# EasyEDA Pro project IPT60R028G7半桥模块.epro

# Schematic Schematic4
Board Name: G7半桥; Create Date: 2025-01-18; Page Name: P1; Project Name: 开关电源实验平台(GaN); Schematic Name: Schematic4; Update Date: 2025-12-15; Company: 嘉立创EDA; Page Size: A4; Version: V1.0
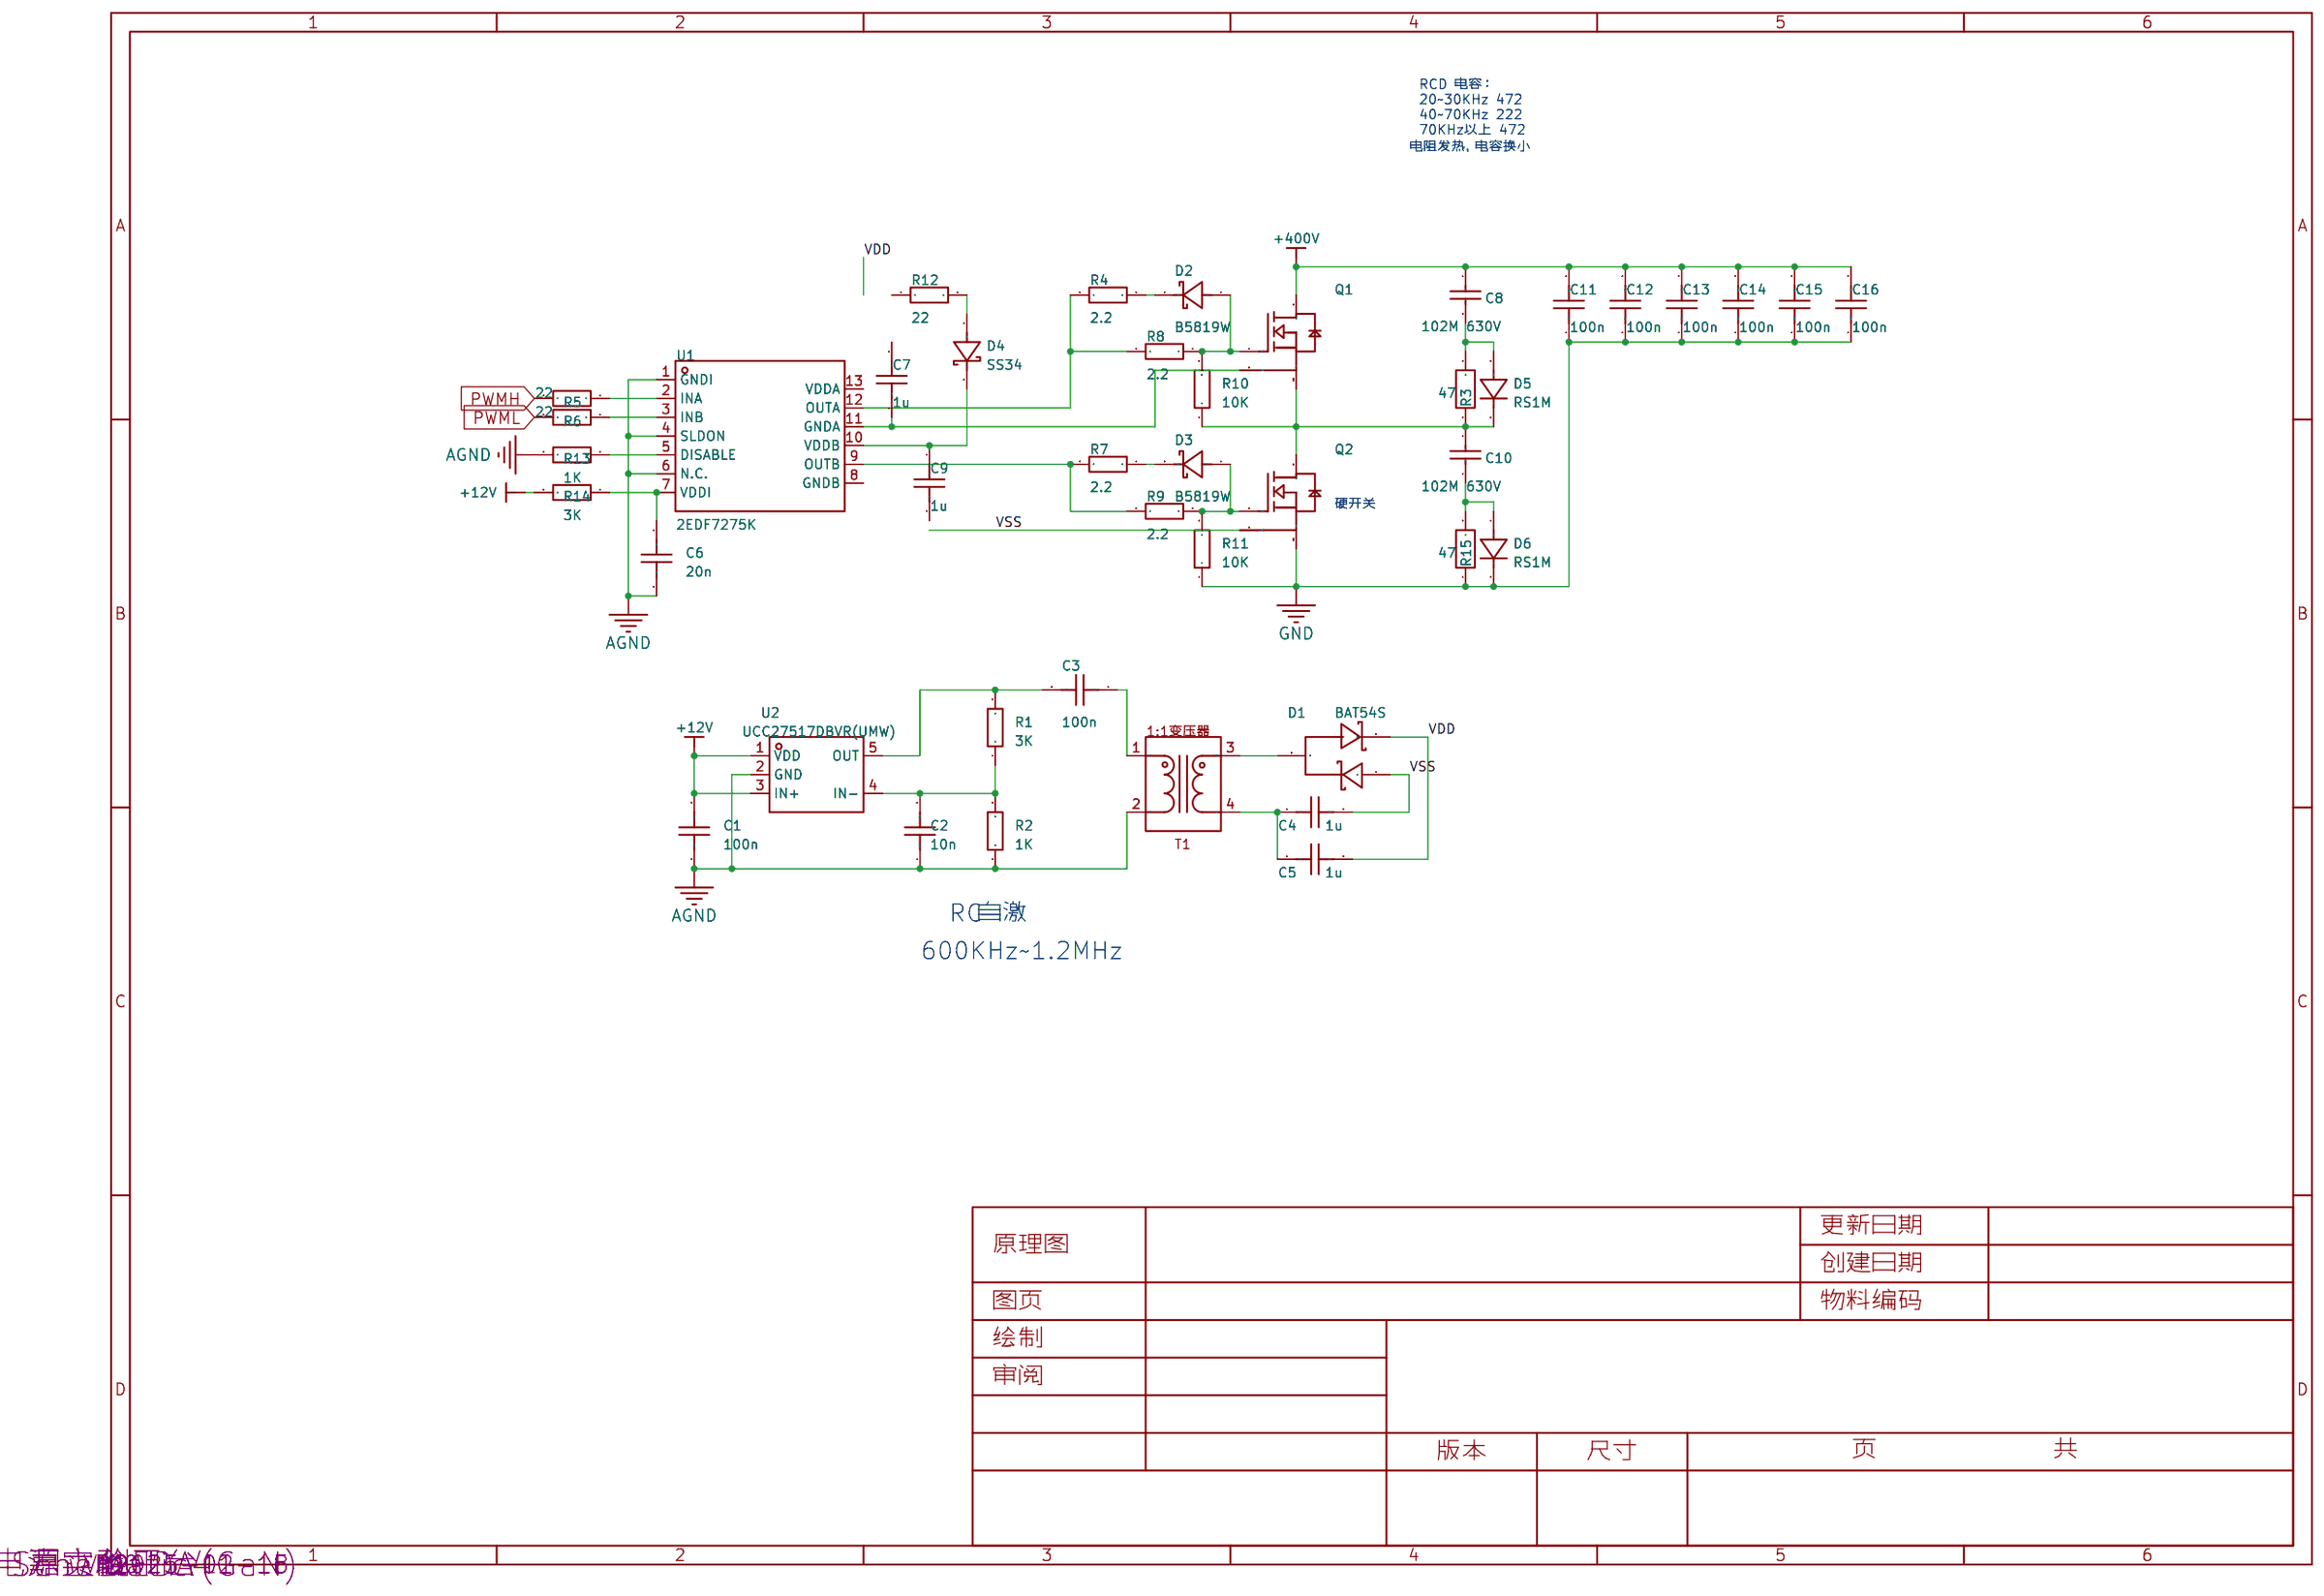
[diagram p0: schematic sheet]

## Parts
C1  100n  [C0603]
C2  10n  [C0603]
C3  100n  [C0603]
C4  1u  [C0805]
C5  1u  [C0805]
C6  20n  [C0603]
C7  1u  [C0603]
C8  102M 630V  [CAP-SMD_L8.0-W6.0-LS11.4]
C9  1u  [C0603]
C10  102M 630V  [CAP-SMD_L8.0-W6.0-LS11.4]
C11  100n  [C1812]
C12  100n  [C1812]
C13  100n  [C1812]
C14  100n  [C1812]
C15  100n  [C1812]
C16  100n  [C1812]
D1  BAT54S  [SOT-23-3_L3.0-W1.7-P0.95-LS2.9-BR]
D2  B5819W  [SOD-123_L2.7-W1.6-LS3.7-FD]
D3  B5819W  [SOD-123_L2.7-W1.6-LS3.7-FD]
D4  SS34  [SMA_L4.3-W2.6-LS5.0-FD]
D5  RS1M  [SMA_L4.3-W2.6-LS5.2-FD]
D6  RS1M  [SMA_L4.3-W2.6-LS5.2-FD]
Q1  -  [PG-HSOF-8-1_L10.4-W9.9-P1.2-LS11.7-TL_IPT60R035CFD7XTMA1]
Q2  -  [PG-HSOF-8-1_L10.4-W9.9-P1.2-LS11.7-TL_IPT60R035CFD7XTMA1]
R1  3K  [R0805]
R2  1K  [R0805]
R3  47  [R2512]
R4  2.2  [R0603]
R5  22  [R0603]
R6  22  [R0603]
R7  2.2  [R0603]
R8  2.2  [R0603]
R9  2.2  [R0603]
R10  10K  [R0805]
R11  10K  [R0805]
R12  22  [R0805]
R13  1K  [R0603]
R14  3K  [R0603]
R15  47  [R2512]
U1  2EDF7275K  [LGA-13_L5.0-W5.0-P0.65-TL]
U2  UCC27517DBVR(UMW)  [SOT-23-5_L3.0-W1.7-P0.95-LS2.8-BR]
U4  -  [迷你隔离变压器]

## Library data of the parts
C1-C3 C6 C7 C9 = CAP_0603: Supplier Footprint: 0603
C4 C5 = CAP_0805: Supplier Footprint: 0805
C8 C10 = 102M 630V: Supplier: LCSC; Supplier Part: C9900002784; Manufacturer Part: 安规Y电容472M 250 400V; Manufacturer: null; JLCPCB Part Class: Extended Part; Contributor: LCSC; spicePre: C; spiceSymbolName: 安规Y电容472M 250 400V
C11-C16 = 1812B104K631NT_C696256: 容值:100nF;精度:±10%;额定电压:630V;材质(温度系数):X7R;; LCSC Part Name: 100nF ±10% 630V; Supplier Part: C696256; Manufacturer: FH(风华); Manufacturer Part: 1812B104K631NT; Supplier Footprint: 1812; JLCPCB Part Class: 扩展库; Datasheet: https://atta.szlcsc.com/upload/public/pdf/source/20200305/C486355_26A10D38EF8C2A5C37091D0039909270.pdf; Supplier: LCSC; Tolerance: ±10%; Voltage Rated: 630V; Temperature Coefficient: X7R
D1 = BAT54S,215: 二极管配置:1对串联式;正向压降(Vf):800mV@100mA;直流反向耐压(Vr):30V;整流电流:200mA;; LCSC Part Name: 电压:30V 电流:200mA; Supplier Part: C47546; Manufacturer: Nexperia(安世); Supplier Footprint: SOT-23; JLCPCB Part Class: 扩展库; Datasheet: https://item.szlcsc.com/datasheet/BAT54S%252C215/48551.html; Supplier: LCSC; Diode Configuration: 1对串联式; Voltage - Forward(Vf@If): 800mV@100mA; Voltage - DC Reverse(Vr): 30V; Current - Rectified: 200mA; Reverse Leakage Current (Ir): 2uA@25V; Non-Repetitive Peak Forward Surge Current: 600mA
D2 D3 = B5819W_C7420330: 二极管配置:独立式;正向压降(Vf):550mV@1.0A;直流反向耐压(Vr):40V;整流电流:1A;; LCSC Part Name: 电压:40V 电流:1A; Supplier Part: C7420330; Manufacturer: 宏迦橙; Supplier Footprint: SOD-123; JLCPCB Part Class: 扩展库; Datasheet: https://atta.szlcsc.com/upload/public/pdf/source/20230828/EE0D571642CD3E42C48F1182066654A1.pdf; Supplier: LCSC; Diode Configuration: 独立式; Forward Voltage (Vf@If): 550mV@1.0A; Reverse Voltage (Vr): 40V; Rectified Current: 1A; Reverse Leakage Current (Ir): 1mA@30V
D4 = SS34_C7420365: 二极管配置:独立式;正向压降(Vf):550mV@3.0A;直流反向耐压(Vr):40V;平均整流电流(Io):3A;; LCSC Part Name: 电压:40V 电流:3A; Supplier Part: C7420365; Manufacturer: 宏迦橙; Supplier Footprint: SMA(DO-214AC); JLCPCB Part Class: 扩展库; Datasheet: https://atta.szlcsc.com/upload/public/pdf/source/20230828/75438452AEE6C276EDA92B2AF599BE05.pdf; Supplier: LCSC; Diode Configuration: 独立式; Forward Voltage (Vf@If): 550mV@3.0A; Reverse Voltage (Vr): 40V; Average Rectified Current (Io): 3A; Reverse Leakage Current (Ir): 200uA@40V; Peak forward surge current: 80A
D5 D6 = RS1M_C84573: 二极管配置:-;正向压降(Vf):1.3V@1A;直流反向耐压(Vr):1kV;整流电流:1A;反向恢复时间(Trr):500ns;; Supplier Part: C84573; Manufacturer: onsemi(安森美); Supplier Footprint: SMA(DO-214AC); JLCPCB Part Class: 扩展库; Datasheet: https://item.szlcsc.com/datasheet/RS1M/85743.html; Supplier: LCSC; Voltage - Forward(Vf@If): 1.3V@1A; Voltage - DC Reverse(Vr): 1kV; Current - Rectified: 1A; Reverse Leakage Current (Ir): 5uA@1kV; Reverse Recovery Time (trr): 500ns; Operating Junction Temperature Range: -55℃~+150℃; Pd - Power Dissipation: 1.19W; Non-Repetitive Peak Forward Surge Current: 30A
Q1 Q2 = IPT60R028G7: 650V245A28mΩ123nC
R1 R2 R10-R12 = Res_0805: Supplier Footprint: 0805
R3 R15 = 10k: nameAlias: Value(Ω); Contributor: LCEDA_Lib; spicePre: R; spiceSymbolName: R_AXIAL-0.5_EU
R4-R9 R13 R14 = Res_0603: Supplier Footprint: 0603
U1 = 2EDF7275K_C2677063: 驱动配置:半桥;负载类型:MOSFET;驱动通道数:2;峰值灌电流:8A;峰值拉电流:4A;电源电压:3V~3.5V;上升时间:6.5ns;下降时间:4.5ns;; Supplier Part: C2677063; Manufacturer: Infineon(英飞凌); Supplier Footprint: TFLGA-13; JLCPCB Part Class: 扩展库; Datasheet: https://atta.szlcsc.com/upload/public/pdf/source/20210606/C69F41D9A598FEEE25D6E8D6BBA83E77.pdf; Supplier: LCSC; Driven Configuration: 半桥; Load Type: MOSFET; Number of Drivers: 2; Peak Output Current(sink): 8A; Peak Output Current(source): 4A; Supply Voltage: 3V~3.5V; Rise Time: 6.5ns; Fall Time: 4.5ns; Operating Temperature: -40℃~+125℃@(Ta)
U2 = UCC27517DBVR(UMW): Supplier Part: C20623191; Manufacturer: UMW(友台半导体); Supplier Footprint: SOT-23-5; JLCPCB Part Class: 扩展库; Datasheet: https://atta.szlcsc.com/upload/public/pdf/source/20240221/377012E13C37207AC8C9D9341CE07B53.pdf; Supplier: LCSC
U4 = 隔离迷你变压器: 变比1：1

## Nets
+12V: C1.2 R14.2 U2.1(VDD) U2.3(IN+)
+400V: C8.1 C11.2 C12.2 C13.2 C14.2 C15.2 C16.2 Q1.9(D)
AGND: C1.1 C2.1 C6.2 R2.1 R13.2 U1.1(GNDI) U1.4(SLDON) U1.6(N.C.) U2.2(GND) U4.2(3)
GND: C11.1 C12.1 C13.1 C14.1 C15.1 C16.1 D6.2(K) Q2.3,4,5,6,7,8(S) R11.1 R15.1
VDD: C5.2 C7.1 D1.2(K) R12.1 U1.13(VDDA)
VSS: C4.2 C9.2 D1.1(A) Q2.2(S) U1.8(GNDB)
PWMH: R5.2
PWML: R6.2
$1N844: C2.2 R1.1 R2.2 U2.4(IN-)
$1N859: C3.2 R1.2 U2.5(OUT)
$1N994: C3.1 U4.1
$1N1111: D1.3(AK) U4.3(6)
$1N1173: C4.1 C5.1 U4.4
$1N1278: C6.1 R14.1 U1.7(VDDI)
$1N1386: R5.1 U1.2(INA)
$1N1390: R6.1 U1.3(INB)
$1N1992: D2.1(A) Q1.1(G) R8.1 R10.2
$1N2020: D3.1(A) Q2.1(G) R9.1 R11.2
$1N2779: C7.2 Q1.2(S) U1.11(GNDA)
$1N4845: C9.1 D4.2(K) U1.10(VDDB)
$1N5394: R13.1 U1.5(DISABLE)
$1N8959: D4.1(A) R12.2
$1N8960: C8.2 D5.1(A) R3.2
$1N8961: D2.2(K) R4.1
$1N8962: R4.2 R8.2 U1.12(OUTA)
$1N8963: D3.2(K) R7.1
$1N8964: R7.2 R9.2 U1.9(OUTB)
$1N8965: C10.2 D6.1(A) R15.2
Net-(C10-1): C10.1 D5.2(K) Q1.3,4,5,6,7,8(S) Q2.9(D) R3.1 R10.1

## Notes on the sheet
- RCD 电容：
  20~30KHz 472
  40~70KHz 222
  70KHz以上 472
- 电阻发热，电容换小
- 硬开关
- RC
- 自激
- 600KHz~1.2MHz

# Board PCB9
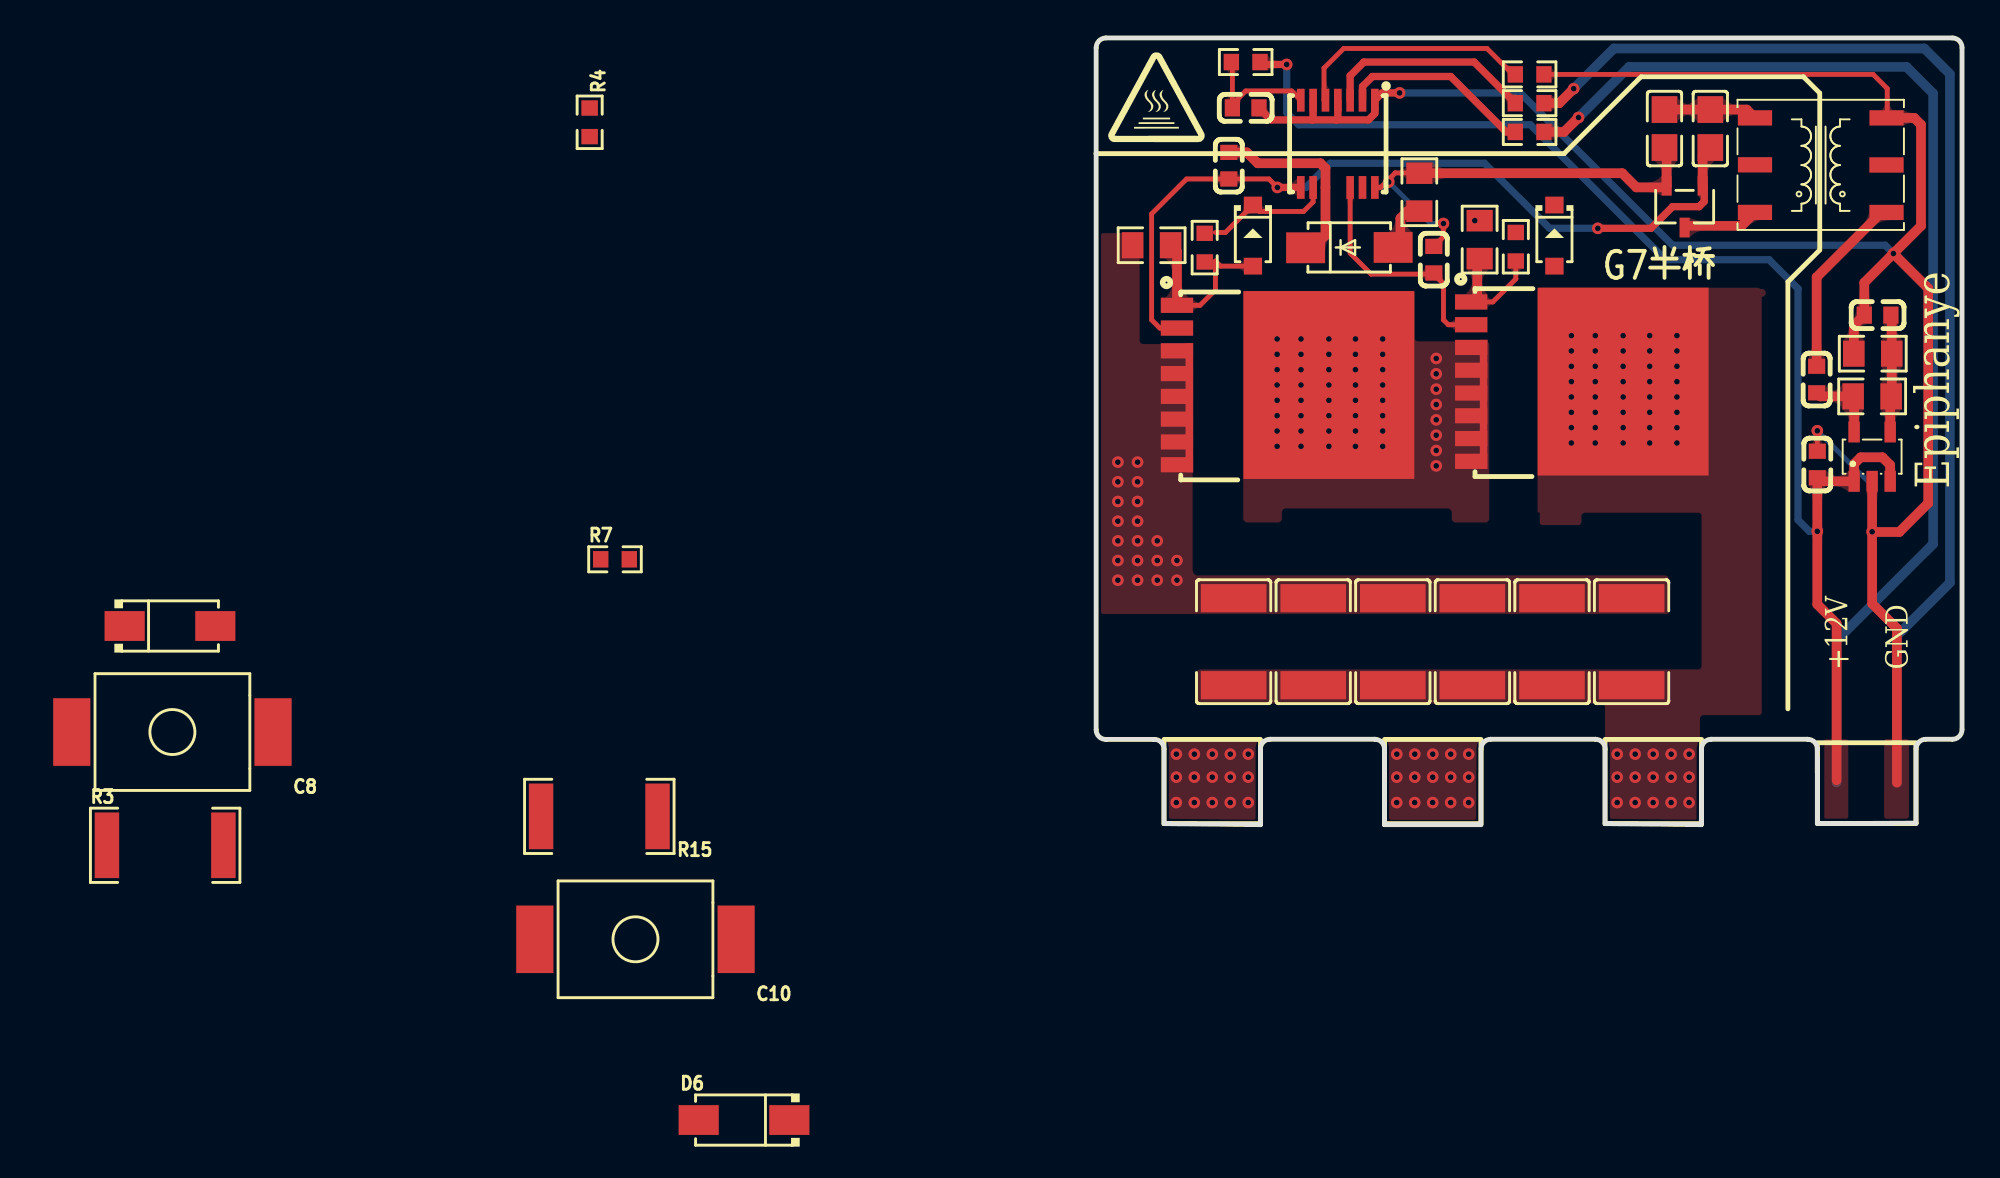
[diagram p1: board, top side]
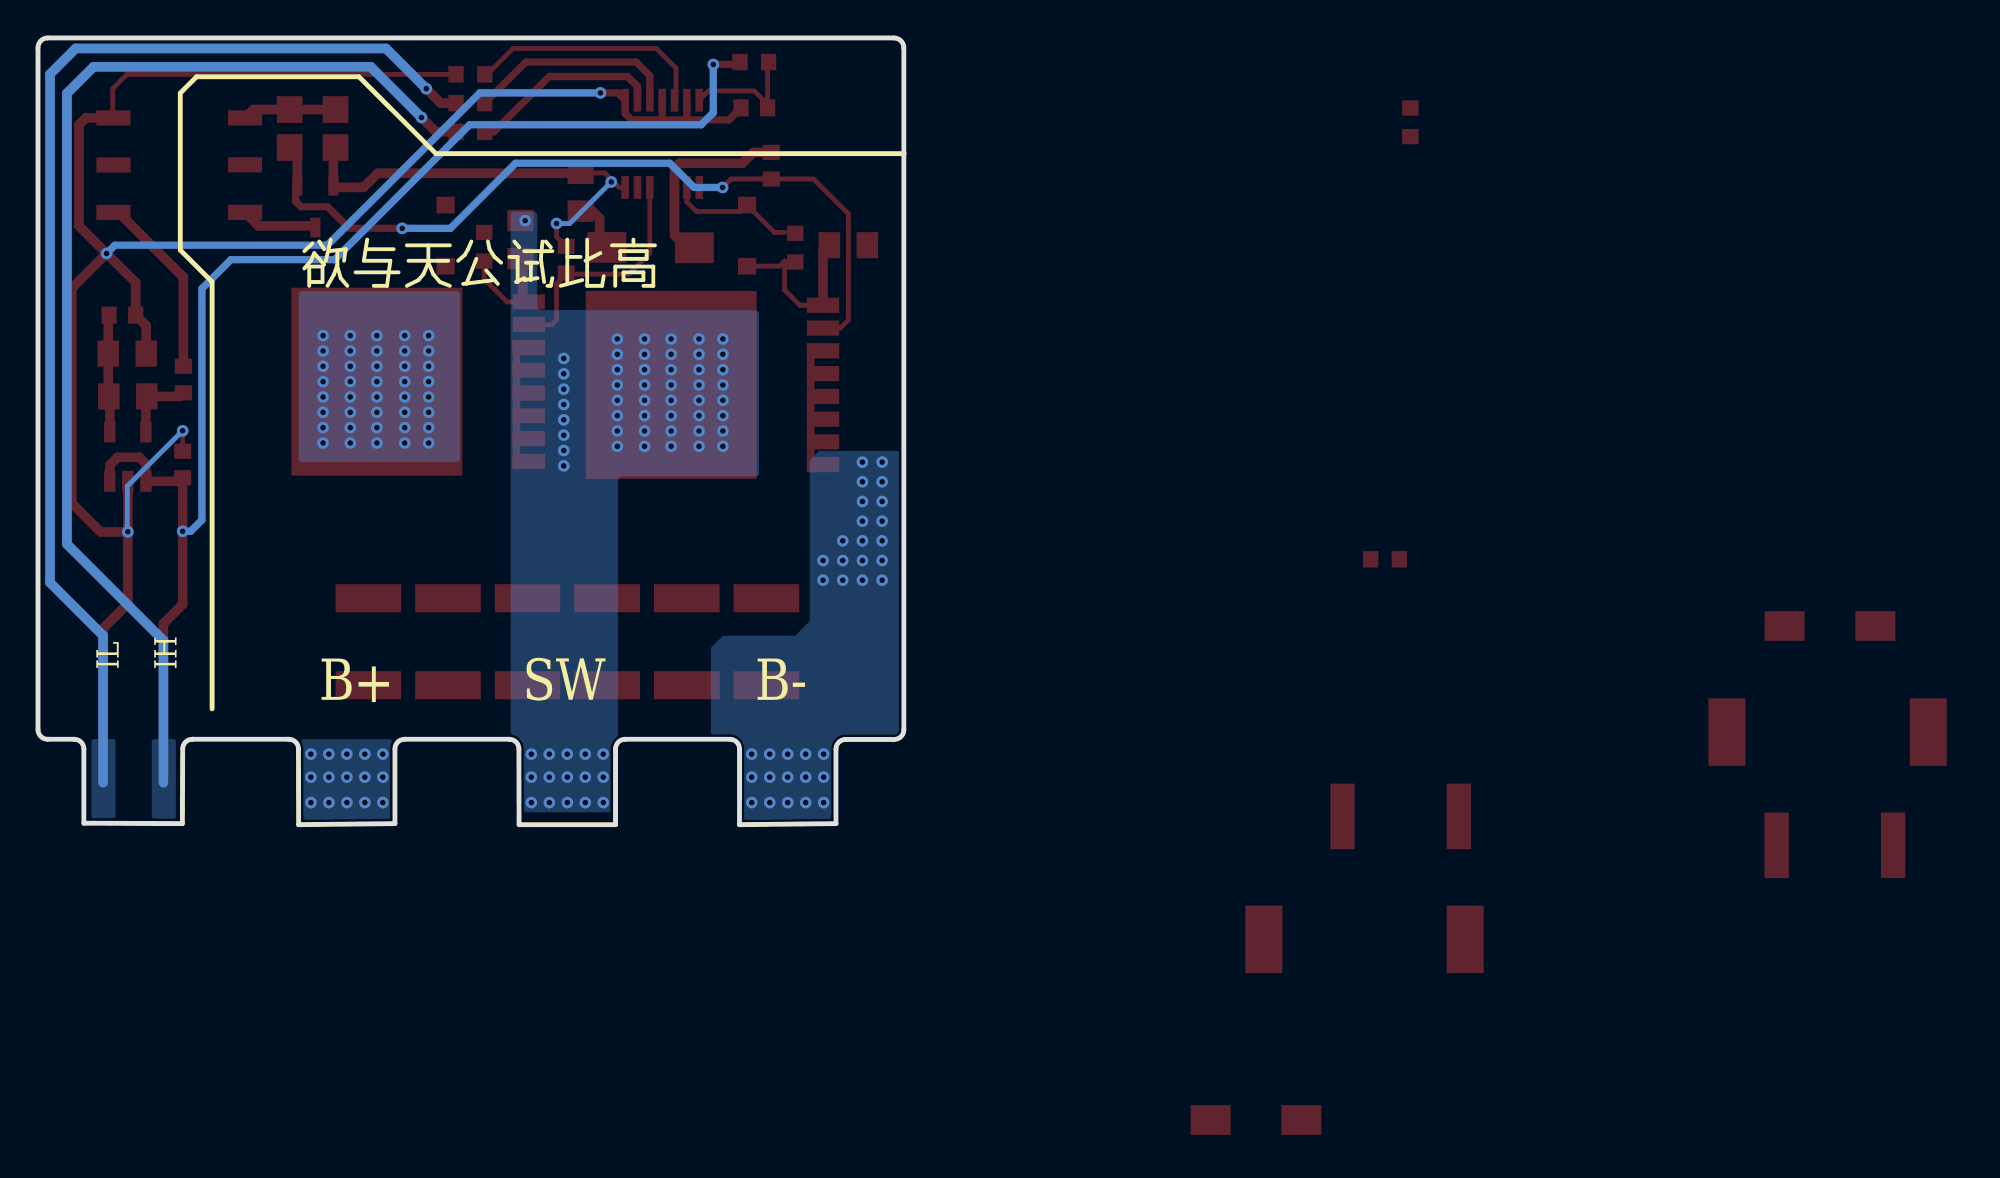
[diagram p2: board, bottom side, seen from below]

Outline 45.59 x 41.46 mm; copper layers: Top Layer, Bottom Layer. Coordinates in mm from the lower left corner of the outline.
Outline path: 0,40.94 arc(0.15,41.3) 0.51,41.46 45.08,41.46 arc(45.44,41.3) 45.59,40.94 45.59,5.01 arc(45.44,4.65) 45.08,4.5 43.68,4.5 arc(43.33,4.35) 43.18,3.99 43.18,0.08 37.99,0.05 37.97,3.99 arc(37.82,4.35) 37.46,4.5 32.39,4.5 arc(32.03,4.35) 31.88,3.99 31.87,0 26.8,0.05 26.8,3.99 arc(26.65,4.35) 26.29,4.5 20.78,4.5 arc(20.42,4.35) 20.27,3.99 20.26,0 15.18,0 15.18,3.99 arc(15.03,4.35) 14.67,4.5 9.16,4.5 arc(8.8,4.35) 8.65,3.99 8.65,0 3.57,0.05 3.57,3.98 arc(3.43,4.34) 3.07,4.49 0.51,4.49 arc(0.15,4.64) 0,5 0,40.94
Stack: Top Layer 0.035mm / Dielectric1 1.51mm FR4 er 4.5 / Bottom Layer 0.035mm

## Design rules (mm)
spacing copperThickness1oz (default): track to track 0.102, other pairs 0.152 to 0.3
spacing copperThickness2oz: track to track 0.203, other pairs 0.152 to 0.3
spacing Plane_innerPlane: track to track 0.102, other pairs 0.152 to 0.3
spacing Copper_copperRegion: track to track 0.102, other pairs 0.152 to 0.3
track width copperThickness1oz (default): min 0.127, default 0.254, max 2.54
track width copperThickness2oz: min 0.203, default 0.254, max 2.54
differential pair differentialPair (default): width min 0.127, default 0.254, max 2.54; gap min 0.152, default 0.152
pour e479 uses Copper_copperRegion
pour e481 uses Copper_copperRegion
pour e483 uses Copper_copperRegion
pour e485 uses Copper_copperRegion
pour e486 uses Copper_copperRegion
pour e488 uses Copper_copperRegion
pour e490 uses Copper_copperRegion
pour e492 uses Copper_copperRegion
pour e494 uses Copper_copperRegion
pour e496 uses Copper_copperRegion
pour e498 uses Copper_copperRegion
pour e500 uses Copper_copperRegion
pour e502 uses Copper_copperRegion
pour e504 uses Copper_copperRegion
pour e506 uses Copper_copperRegion
pour e508 uses Copper_copperRegion
pour e510 uses Copper_copperRegion

## Placement (name value [footprint] x y rotation side)
C1  100n  [C0603]  37.97 18.98 270 top
C2  10n  [C0603]  41.15 26.85 0 top
C3  100n  [C0603]  37.94 23.46 270 top
C4  1u  [C0805]  32.34 36.68 270 top
C5  1u  [C0805]  29.93 36.68 270 top
C6  20n  [C0603]  7.87 37.77 0 top
C7  1u  [C0603]  17.78 29.77 270 top
C8  102M 630V  [CAP-SMD_L8.0-W6.0-LS11.4]  -48.64 4.88 180 top
C9  1u  [C0603]  6.98 34.73 270 top
C10  102M 630V  [CAP-SMD_L8.0-W6.0-LS11.4]  -24.26 -6.04 180 top
C11  100n  [C1812]  15.62 9.64 270 top
C12  100n  [C1812]  28.19 9.64 270 top
C13  100n  [C1812]  24 9.64 270 top
C14  100n  [C1812]  19.81 9.64 270 top
C15  100n  [C1812]  11.43 9.64 270 top
C16  100n  [C1812]  7.24 9.64 270 top
D1  BAT54S  [SOT-23-3_L3.0-W1.7-P0.95-LS2.9-BR]  30.99 32.57 90 top
D2  B5819W  [SOD-123_L2.7-W1.6-LS3.7-FD]  24.13 31.04 90 top
D3  B5819W  [SOD-123_L2.7-W1.6-LS3.7-FD]  8.26 31.04 90 top
D4  SS34  [SMA_L4.3-W2.6-LS5.0-FD]  13.33 30.41 180 top
D5  RS1M  [SMA_L4.3-W2.6-LS5.2-FD]  -48.77 10.47 180 top
D6  RS1M  [SMA_L4.3-W2.6-LS5.2-FD]  -18.54 -15.57 0 top
Q1  -  [PG-HSOF-8-1_L10.4-W9.9-P1.2-LS11.7-TL_IPT60R035CFD7XTMA1]  23.75 23.35 0 top
Q2  -  [PG-HSOF-8-1_L10.4-W9.9-P1.2-LS11.7-TL_IPT60R035CFD7XTMA1]  8.26 23.17 0 top
R1  3K  [R0805]  40.86 22.57 180 top
R2  1K  [R0805]  40.89 24.82 0 top
R3  47  [R2512]  -49.02 -1.09 0 top
R4  2.2  [R0603]  -26.67 37.01 270 top
R5  22  [R0603]  22.82 36.5 0 top
R6  22  [R0603]  22.82 38.02 0 top
R7  2.2  [R0603]  -25.34 13.98 0 top
R8  2.2  [R0603]  22.1 30.45 90 top
R9  2.2  [R0603]  5.71 30.41 90 top
R10  10K  [R0805]  20.19 30.83 270 top
R11  10K  [R0805]  2.92 30.53 0 top
R12  22  [R0805]  17.02 33.33 270 top
R13  1K  [R0603]  22.82 39.54 0 top
R14  3K  [R0603]  7.87 40.19 0 top
R15  47  [R2512]  -26.16 0.44 180 top
U1  2EDF7275K  [LGA-13_L5.0-W5.0-P0.65-TL]  12.73 35.88 270 top
U2  UCC27517DBVR(UMW)  [SOT-23-5_L3.0-W1.7-P0.95-LS2.8-BR]  40.86 19.39 270 top
U4  -  [迷你隔离变压器]  38.15 34.76 180 top

## Footprints (pads in the part's own frame, mm; a bottom-side part is the same pattern mirrored in y, then rotated)
C0603
  rect 0.8x0.9 smd: 1(-0.7,0) 2(0.7,0)
C0805
  rect 1.41x1.35 smd: 1(-1,0) 2(1,0)
C1812
  rect 1.485x3.456 smd: 1(-2.292,0) 2(2.292,0)
CAP-SMD_L8.0-W6.0-LS11.4
  rect 1.95x3.556 smd: 1(-5.3,0) 2(5.3,0)
LGA-13_L5.0-W5.0-P0.65-TL
  rect 1.2x0.4 smd: 1(-2.3,1.95) 2(-2.3,1.3) 3(-2.3,0.65) 4(-2.3,0) 5(-2.3,-0.65) 6(-2.3,-1.3) 7(-2.3,-1.95) 8(2.3,-1.95) 9(2.3,-1.3) 10(2.3,-0.65) 11(2.3,0.65) 12(2.3,1.3) 13(2.3,1.95)
PG-HSOF-8-1_L10.4-W9.9-P1.2-LS11.7-TL_IPT60R035CFD7XTMA1
  rect 1.7x0.8 smd: 1(-4,4.2) 2(-4,3) 3(-4,1.8) 4(-4,0.6) 5(-4,-0.6) 6(-4,-1.8) 7(-4,-3) 8(-4,-4.2)
  rect 0.4x6.8 smd: 8(-3.35,-1.2)
  rect 9x9.9 smd: 9(4,0)
R0603
  rect 0.806x0.864 smd: 1(-0.753,0) 2(0.753,0)
R0805
  rect 1.133x1.377 smd: 1(-1,0) 2(1,0)
R2512
  rect 1.282x3.456 smd: 1(-3.066,0) 2(3.066,0)
SMA_L4.3-W2.6-LS5.0-FD
  rect 2.046x1.62 smd: 1(-2.304,-0.009) 2(2.304,0.009)
SMA_L4.3-W2.6-LS5.2-FD
  rect 2.107x1.566 smd: 1(-2.386,0) 2(2.386,0)
SOD-123_L2.7-W1.6-LS3.7-FD
  rect 0.88x0.96 smd: 1(-1.61,0) 2(1.61,0)
SOT-23-3_L3.0-W1.7-P0.95-LS2.9-BR
  rect 1.038x0.532 smd: 1(1.101,-0.95) 2(1.101,0.95) 3(-1.101,0)
SOT-23-5_L3.0-W1.7-P0.95-LS2.8-BR
  rect 1.1x0.6 smd: 1(1.3,-0.95) 2(1.3,0) 3(1.3,0.95) 4(-1.3,0.95) 5(-1.3,-0.95)
迷你隔离变压器
  rect 1.8x0.8 smd: (-3.466,-0.008) (3.461,-0.014) 1(-3.467,2.496) 2(-3.47,-2.49) 3(3.463,2.493) 4(3.462,-2.49)

## Nets
As in the schematic, except:
GND: C11.1 C12.1 C13.1 C14.1 C15.1 C16.1 D6.2 Q2.3 Q2.4 Q2.5 Q2.6 Q2.7 Q2.8 R11.1 R15.1
$1N2773: C10.1 D5.2 Q1.3 Q1.4 Q1.5 Q1.6 Q1.7 Q1.8 Q2.9 R3.1 R10.1

## Via types
v1: diameter 0.61, hole 0.305, Top Layer to Bottom Layer, 165 vias

## Routing (per net, layer and track width the routed paths; a pad name or vN(x,y) marks a point on that pad's centre or on a via; arc(x,y) is an arc through that point)
+12V: length 70.6
  Top Layer w0.381: v1(10.03,40.06) 8.75,40.06 R14.2
  Top Layer w0.508: 38.99,2.34 38.99,10.6 37.97,11.61 v1(37.97,15.46) C1.2 38.16,18.09 U2.1 39.91,19.01 40.26,19.36 41.4,19.36 41.81,18.95 U2.3
  Bottom Layer w0.381: v1(37.97,15.46) 37.55,15.46 36.96,16.06 36.96,28.25 35.43,29.77 29.97,29.77 22.86,36.88 10.67,36.88 10.03,37.52 v1(10.03,40.06)
+400V:
  vias: v1(25.02,25.77) v1(25.02,24.96) v1(25.02,24.15) v1(25.02,23.35) v1(25.02,22.54) v1(25.02,21.73) v1(25.02,20.92) v1(25.02,20.11) v1(26.28,25.77) v1(26.28,24.96) v1(26.28,24.15) v1(26.28,23.35) v1(26.28,22.54) v1(26.28,21.73) v1(26.28,20.92) v1(26.28,20.11) v1(27.44,3.72) v1(27.44,2.5) v1(27.43,1.16) v1(27.75,25.77) v1(27.75,24.96) v1(27.75,24.15) v1(27.75,23.35) v1(27.75,22.54) v1(27.75,21.73) v1(27.75,20.92) v1(27.75,20.11) v1(28.38,3.72) v1(28.38,2.5) v1(28.38,1.16) v1(29.15,25.77) v1(29.15,24.96) v1(29.15,24.15) v1(29.15,23.35) v1(29.15,22.54) v1(29.15,21.73) v1(29.15,20.92) v1(29.15,20.11) v1(29.33,3.72) v1(29.33,2.5) v1(29.33,1.16) v1(30.28,3.72) v1(30.28,2.5) v1(30.27,1.16) v1(30.58,25.77) v1(30.58,24.96) v1(30.58,24.15) v1(30.58,23.35) v1(30.58,22.54) v1(30.58,21.73) v1(30.58,20.92) v1(30.58,20.11) v1(31.22,1.16) v1(31.23,3.72) v1(31.22,2.5)
AGND: length 117.3
  Top Layer w0.254: C1.1 v1(37.97,20.76) ; R13.2 40.91,39.54 41.66,38.79 41.66,37.28 41.62,37.25
  Top Layer w0.381: 11.39,37.14 12.65,37.14 ; 11.39,37.14 9.21,37.14 C6.2 ; 11.39,37.14 11.42,37.17 U1.6 ; 12.65,37.14 14.34,37.14 14.67,37.47 U1.1 15.06,38.56 v1(15.98,38.56) ; 12.65,37.14 12.73,37.21 U1.4
  Top Layer w0.508: U2.2 v1(40.86,15.43) ; v1(40.86,15.43) 40.86,11.65 42.16,10.34 42.16,2.21 ; v1(40.86,15.43) 40.87,15.42 42.29,15.42 43.82,16.95 43.82,28.26 v1(41.98,30.1) ; 41.62,37.25 41.62,37.24 43.08,37.24 43.43,36.88 43.43,31.55 v1(41.98,30.1) ; R2.1 39.89,26.3 C2.1 40.45,28.56 v1(41.98,30.1)
  Bottom Layer w0.254: v1(37.97,20.76) 40.89,17.83 40.89,15.47 v1(40.86,15.43)
  Bottom Layer w0.381: v1(15.98,38.56) 22.33,38.56 30.35,30.53 41.54,30.53 v1(41.98,30.1)
GND:
  vias: v1(1.14,19.1) v1(1.14,18.07) v1(1.14,17.03) v1(1.14,15.99) v1(1.14,14.96) v1(1.14,13.92) v1(1.14,12.88) v1(2.18,19.1) v1(2.18,18.07) v1(2.18,17.03) v1(2.18,15.99) v1(2.18,14.96) v1(2.18,13.92) v1(2.18,12.88) v1(3.22,14.96) v1(3.22,13.92) v1(3.22,12.88) v1(4.22,2.5) v1(4.22,1.16) v1(4.25,13.92) v1(4.25,12.88) v1(4.22,3.72) v1(5.17,3.72) v1(5.17,2.5) v1(5.17,1.16) v1(6.12,3.72) v1(6.12,2.5) v1(6.11,1.16) v1(7.06,3.72) v1(7.06,2.5) v1(7.06,1.16) v1(8.01,3.72) v1(8.01,2.5) v1(8.01,1.16)
VDD: length 23.3
  Top Layer w0.254: R12.1 17,34.34 15.75,34.34 14.98,33.58 U1.13 ; v1(18.29,31.68) 18.29,30.98 C7.1
  Top Layer w0.508: R12.1 27.7,34.33 28.45,33.58 29.95,33.58 D1.2 30.04,35.57 C5.2
  Bottom Layer w0.254: v1(15.41,33.87) 17.6,31.68 v1(18.29,31.68)
VSS: length 44
  Top Layer w0.254: v1(9.54,33.58) 9.1,34.03 C9.2 4.76,34.03 2.92,32.19 2.92,26.6 3.35,26.17 Q2.2
  Top Layer w0.381: U1.8 v1(9.54,33.58) ; v1(26.42,31.42) 29.21,31.42 30.35,32.57 31.75,32.57 32.02,32.84 32.02,33.59 D1.1
  Top Layer w0.508: C4.2 31.94,35.28 D1.1
  Bottom Layer w0.381: v1(9.54,33.58) 11.04,33.58 12.32,34.85 20.45,34.85 23.88,31.42 v1(26.42,31.42)
PWMH: length 60.9
  Top Layer w0.508: R5.2 24.64,36.5 v1(25.4,37.27)
  Bottom Layer w0.508: v1(25.4,37.27) 28.07,39.93 42.67,39.93 44.07,38.54 44.07,14.79 38.99,9.71 38.99,2.21
PWML: length 61.6
  Top Layer w0.508: R6.2 24.38,38.02 v1(25.15,38.78)
  Bottom Layer w0.508: v1(25.15,38.78) 27.27,40.9 43.61,40.9 44.96,39.55 44.96,12.75 42.16,9.96 42.16,2.21
$1N844: length 6.2
  Top Layer w0.508: C2.2 41.89,26.81 R2.2 41.89,22.6 R1.1 41.81,22.52 41.81,20.69
$1N859: length 3.9
  Top Layer w0.508: C3.2 38.13,22.57 R1.2 39.91,22.52 39.91,20.69
$1N994: length 9.8
  Top Layer w0.508: C3.1 37.94,28.85 41.35,32.26 41.62,32.26
$1N1111: length 4
  Top Layer w0.508: U4.3 33.98,31.55 31.01,31.55
$1N1173: length 4.9
  Top Layer w0.508: U4.4 34.26,37.68 C4.1 C5.1
$1N1278: length 6.5
  Top Layer w0.254: R14.1 7.17,40.13 7.17,37.96 ; 7.17,37.77 7.17,37.96 ; 7.17,37.96 7.87,38.66 10.29,38.66 U1.7
$1N1386: length 10.2
  Top Layer w0.381: U1.2 14.02,38.9 14.55,39.42 18.67,39.42 21.59,36.5 R5.1
$1N1390: length 11.2
  Top Layer w0.381: U1.3 13.37,39.46 14.1,40.19 19.9,40.19 R6.1
$1N1877: length 6.9
  Top Layer w0.254: 11.42,33.58 11.42,32.82 10.92,32.31 8.6,32.31 8.26,32.65 6.81,31.21 6.28,31.21
$1N1992: length 6.1
  Top Layer w0.254: 20.07,27.55 20.89,27.55 22.1,28.76 22.1,29.7
  Top Layer w0.508: R10.2 20.07,29.7 20.07,27.55 Q1.1
$1N2020: length 9.3
  Top Layer w0.254: D3.1 6.55,29.43 6.28,29.7 6.28,28.18 5.47,27.37 Q2.1
  Top Layer w0.508: Q2.1 4.26,30.2 R11.2
$1N2773:
  vias: v1(9.53,25.59) v1(9.53,24.79) v1(9.53,23.98) v1(9.53,23.17) v1(9.53,22.36) v1(9.53,21.55) v1(9.53,20.74) v1(9.53,19.94) v1(10.79,25.59) v1(10.79,24.79) v1(10.79,23.98) v1(10.79,23.17) v1(10.79,22.36) v1(10.79,21.55) v1(10.79,20.74) v1(10.79,19.94) v1(12.26,25.59) v1(12.26,24.79) v1(12.26,23.98) v1(12.26,23.17) v1(12.26,22.36) v1(12.26,21.55) v1(12.26,20.74) v1(12.26,19.94) v1(13.65,25.59) v1(13.65,24.79) v1(13.65,23.98) v1(13.65,23.17) v1(13.65,22.36) v1(13.65,21.55) v1(13.65,20.74) v1(13.65,19.94) v1(15.09,25.59) v1(15.09,24.79) v1(15.09,23.98) v1(15.09,23.17) v1(15.09,22.36) v1(15.09,21.55) v1(15.09,20.74) v1(15.09,19.94) v1(15.83,3.72) v1(15.83,2.5) v1(15.83,1.16) v1(16.78,3.72) v1(16.78,2.5) v1(16.77,1.16) v1(17.72,2.5) v1(17.72,1.16) v1(17.72,3.72) v1(17.91,24.57) v1(17.91,23.76) v1(17.91,22.95) v1(17.91,22.14) v1(17.91,21.33) v1(17.91,20.52) v1(17.91,19.72) v1(17.91,18.91) v1(18.67,3.72) v1(18.67,2.5) v1(18.67,1.16) v1(19.62,3.72) v1(19.62,2.5) v1(19.61,1.16) v1(19.94,31.83)
$1N2779: length 12.5
  Top Layer w0.254: Q1.2 18.54,26.35 18.29,26.6 18.29,28.5 17.78,29.01 14.48,29.01 13.37,30.11 U1.11
$1N4845: length 9.9
  Top Layer w0.508: 11.41,30.4 12.08,31.06 U1.10 12.08,34.59 11.81,34.85 8.51,34.85 7.94,35.43 C9.1
$1N5394: length 12.8
  Top Layer w0.254: U1.5 12.01,38.18 12,38.19 12,39.87 13.04,40.9 20.58,40.9 21.94,39.54 R13.1
$1N8959: length 2.7
  Top Layer w0.508: R12.2 16.4,32.33 16.02,31.95 16.02,30.42

## Copper pours and planes (outline as drawn; the poured copper is in the pictures)
+12V on Top Layer: 38.34,4.4 38.34,4.44 38.36,4.47 38.4,4.49 38.44,4.5 39.51,4.5 39.54,4.49 39.58,4.47 39.6,4.44 39.61,4.4 39.61,0.1 39.6,0.06 39.58,0.03 39.54,0.01 39.51,0 38.44,0 38.4,0.01 38.36,0.03 38.34,0.06 38.34,0.1
+400V on Bottom Layer: 23.37,28.12 31.88,28.12 31.88,19.1 23.37,19.1
+400V on Bottom Layer: 26.79,4.5 31.87,4.5 31.87,0 26.79,0
AGND on Top Layer: 41.51,4.36 41.52,4.4 41.54,4.43 41.57,4.46 41.61,4.46 42.68,4.46 42.72,4.46 42.75,4.43 42.77,4.4 42.78,4.36 42.78,0.06 42.77,0.03 42.75,-0.01 42.72,-0.03 42.68,-0.04 41.61,-0.04 41.57,-0.03 41.54,-0.01 41.52,0.03 41.51,0.06
AGND on Top Layer: 41.51,4.5 42.78,4.5 42.78,0 41.51,0
AGND on Top Layer: 41.51,4.5 42.78,4.5 42.78,0 41.51,0
AGND on Bottom Layer: 41.51,4.5 42.78,4.5 42.78,0 41.51,0
GND on Top Layer: 30.15,11.27 30.13,11.15 30.03,11.1 0.3,11.1 0.14,11.27 0.1,11.49 0.1,30.97 0.16,31.11 0.3,31.17 2.09,31.17 2.23,31.11 2.29,30.97 2.29,25.53 2.34,25.39 2.49,25.33 4.88,25.33 5.02,25.27 5.08,25.13 5.08,13.44 5.13,13.26 5.28,13.14 29.95,13.14 30.09,13.08 30.15,12.95
GND on Top Layer: 3.57,4.5 8.65,4.5 8.65,0 3.57,0
GND on Bottom Layer: 3.57,4.5 8.65,4.5 8.65,0 3.57,0
GND on Bottom Layer: -0.64,19.61 -0.64,0.82 -1.91,-0.45 8.51,-0.45 10.16,1.2 10.16,9.33 9.52,9.96 5.71,9.96 4.95,10.72 4.95,19.21 4.47,19.7 -0.55,19.7
PWMH on Bottom Layer: 38.34,4.4 38.34,4.44 38.36,4.47 38.4,4.49 38.44,4.5 39.51,4.5 39.54,4.49 39.58,4.47 39.6,4.44 39.61,4.4 39.61,0.1 39.6,0.06 39.58,0.03 39.54,0.01 39.51,0 38.44,0 38.4,0.01 38.36,0.03 38.34,0.06 38.34,0.1
PWML on Bottom Layer: 41.51,4.4 41.52,4.44 41.54,4.47 41.57,4.49 41.61,4.5 42.68,4.5 42.72,4.49 42.75,4.47 42.77,4.44 42.78,4.4 42.78,0.1 42.77,0.06 42.75,0.03 42.72,0.01 42.68,0 41.61,0 41.57,0.01 41.54,0.03 41.52,0.06 41.51,0.1
$1N2773 on Top Layer: 20.7,16.13 20.64,15.99 20.5,15.93 18.92,15.93 18.78,15.99 18.72,16.13 18.72,16.46 18.66,16.6 18.52,16.66 9.98,16.66 9.84,16.6 9.78,16.46 9.78,16.13 9.72,15.99 9.58,15.93 7.95,15.93 7.81,15.99 7.75,16.13 7.75,27.92 7.81,28.06 7.95,28.12 16.55,28.12 16.7,28.06 16.76,27.92 16.76,25.67 16.81,25.53 16.95,25.47 20.5,25.47 20.64,25.41 20.7,25.27
$1N2773 on Top Layer: 15.18,4.5 20.26,4.5 20.26,0 15.18,0
$1N2773 on Top Layer: 14.35,4.5 20.79,4.5 20.79,-0.71 14.35,-0.71
$1N2773 on Bottom Layer: 20.7,0.95 20.65,0.77 20.5,0.66 15.26,0.66 15.11,0.82 15.06,1.04 15.06,18.14 15,18.28 14.86,18.34 7.82,18.34 7.68,18.4 7.62,18.54 7.62,26.91 7.68,27.05 7.82,27.11 19.07,27.11 19.22,27.16 19.3,27.31 19.3,32.11 19.36,32.25 19.51,32.31 20.5,32.31 20.64,32.25 20.7,32.11
+400V on Top Layer: 31.88,16.24 31.85,16.37 31.73,16.44 25.75,16.44 25.61,16.38 25.55,16.24 25.55,15.94 25.49,15.82 25.35,15.79 23.55,15.79 23.42,15.8 23.35,15.91 23.35,16.44 23.24,16.44 23.24,28.08 23.3,28.23 23.44,28.3 34.85,28.3 35,28.19 35.05,28.02 35.05,5.97 35.02,5.83 34.9,5.77 31.99,5.77 31.85,5.71 31.79,5.57 31.79,-0.34 31.73,-0.48 31.59,-0.54 26.99,-0.46 26.85,-0.4 26.8,-0.26 26.8,6.18 26.74,6.32 26.6,6.38 5.48,6.38 5.34,6.44 5.28,6.58 5.28,7.98 5.34,8.12 5.48,8.18 31.7,8.18 31.83,8.24 31.88,8.38

Small or netless copper shapes (teardrops, artwork), in the pictures only: 96 on Top Layer, 11 on Bottom Layer

## Text on the board
Bottom Silkscreen Layer: IH | IL | B- | SW | B+ | 欲与天公试比高
Top Silkscreen Layer: G7半桥 | +12V | GND | Epiphanye
